# Altium project OpAmp_Type_3.PrjPcb
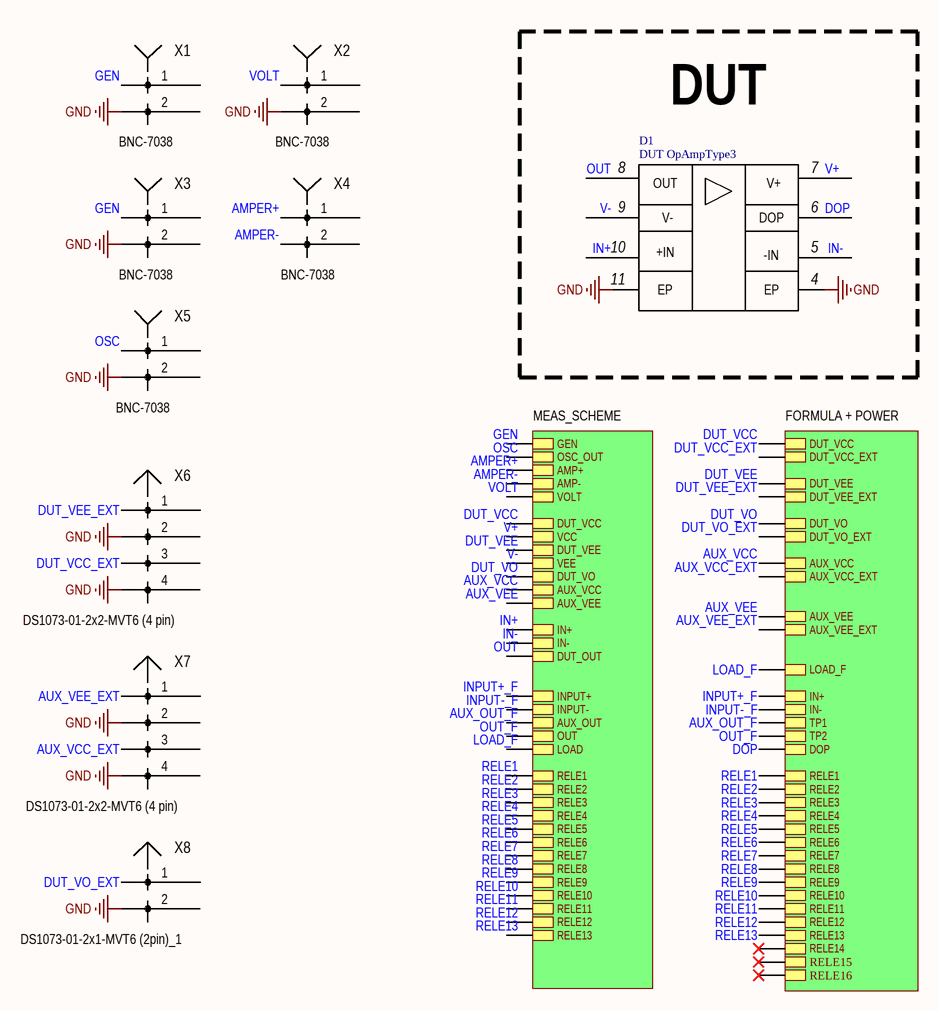
[diagram p0: Main.SchDoc]
4 sheets, 178 parts. Net scope: hierarchical (ports join the sheet entries above them; power ports are global).
Board file: PCB1.PcbDoc
Sheets:
  Main.SchDoc
    FORMULA + POWER = FORMULA.SchDoc
    MEAS_SCHEME = MEAS_SCHEME.SchDoc
      RELE = RELE_BLOCK.SchDoc
      RELE = RELE_BLOCK.SchDoc
      RELE = RELE_BLOCK.SchDoc
      RELE = RELE_BLOCK.SchDoc
      RELE = RELE_BLOCK.SchDoc
      RELE = RELE_BLOCK.SchDoc
      RELE = RELE_BLOCK.SchDoc
      RELE = RELE_BLOCK.SchDoc
      RELE = RELE_BLOCK.SchDoc
      RELE = RELE_BLOCK.SchDoc
      RELE = RELE_BLOCK.SchDoc
      RELE 1 = RELE_BLOCK.SchDoc
      RELE = RELE_BLOCK.SchDoc
      RELE = RELE_BLOCK.SchDoc

## Sheet Main.SchDoc: ТО2192
size 209 x 297 mm; ApprovedBy: Кубатко В.А.; CheckedBy: Кубатко В.А.; Author: Сергеев Д.А.; CompanyName: ГК "СНАБЖЕНИЕ"; DrawnBy: Сергеев Д.А,; Engineer: Сергеев Д.А.; Organization: ГК "СНАБЖЕНИЕ"; DocumentNumber: ТО2192; Revision: 1; SheetNumber: 1; SheetTotal: 4

### Parts
D1  DUT OpAmpType3  [DIP 14]
X1  BNC-7038  [BNC-7038]
X2  BNC-7038  [BNC-7038]
X3  BNC-7038  [BNC-7038]
X4  BNC-7038  [BNC-7038]
X5  BNC-7038  [BNC-7038]
X6  DS1073-01-2x2-MVT6 (4 pin)  [DS1073-01-2x2-MVT6 (4 pin)]
X7  DS1073-01-2x2-MVT6 (4 pin)  [DS1073-01-2x2-MVT6 (4 pin)]
X8  DS1073-01-2x1-MVT6 (2pin)_1  [DS1073-01-2x1-MVT6 (2 pin) - duplicate]

### Blocks framed on the sheet
DUT: D1

### Sub-sheets
FORMULA + POWER = FORMULA.SchDoc: DUT_VEE, DUT_VCC, DUT_VO, RELE1, RELE9, RELE11, RELE5, RELE2, RELE7, RELE13, RELE12, RELE14, RELE4, RELE6, RELE3, RELE8, RELE10, AUX_VCC, DUT_VCC_EXT, AUX_VEE_EXT, DUT_VO_EXT, AUX_VEE, AUX_VCC_EXT, DUT_VEE_EXT, IN-, TP1, DOP, IN+, TP2, LOAD_F, RELE15, RELE16
MEAS_SCHEME = MEAS_SCHEME.SchDoc: GEN, OSC_OUT, AMP-, VOLT, DUT_VEE, VCC, AMP+, VEE, RELE2, DUT_VCC, RELE5, RELE4, RELE6, RELE3, RELE9, RELE10, RELE13, DUT_VO, IN-, RELE8, RELE12, RELE11, IN+, AUX_VEE, RELE7, AUX_VCC, OUT, AUX_OUT, INPUT-, INPUT+, DUT_OUT, LOAD, RELE1

### Nets
GND: D1.4 D1.11 X1.2 X2.2 X3.2 X5.2 X6.2 X6.4 X7.2 X7.4 X8.2
AMPER+: X4.1 ; sheet MEAS_SCHEME/AMP+  [project net AMP+]
AMPER-: X4.2 ; sheet MEAS_SCHEME/AMP-  [project net AMP-]
AUX_OUT_F: sheet FORMULA + POWER/TP1, sheet MEAS_SCHEME/AUX_OUT  [project net AUX_OUT]
AUX_VCC: sheet FORMULA + POWER/AUX_VCC, sheet MEAS_SCHEME/AUX_VCC
AUX_VCC_EXT: X7.3 ; sheet FORMULA + POWER/AUX_VCC_EXT  [project net +12V]
AUX_VEE: sheet FORMULA + POWER/AUX_VEE, sheet MEAS_SCHEME/AUX_VEE
AUX_VEE_EXT: X7.1 ; sheet FORMULA + POWER/AUX_VEE_EXT  [project net -12V]
DOP: D1.6 ; sheet FORMULA + POWER/DOP
DUT_VCC: sheet FORMULA + POWER/DUT_VCC, sheet MEAS_SCHEME/DUT_VCC
DUT_VCC_EXT: X6.3 ; sheet FORMULA + POWER/DUT_VCC_EXT
DUT_VEE: sheet FORMULA + POWER/DUT_VEE, sheet MEAS_SCHEME/DUT_VEE
DUT_VEE_EXT: X6.1 ; sheet FORMULA + POWER/DUT_VEE_EXT
DUT_VO: sheet FORMULA + POWER/DUT_VO, sheet MEAS_SCHEME/DUT_VO
DUT_VO_EXT: X8.1 ; sheet FORMULA + POWER/DUT_VO_EXT
GEN: X1.1 X3.1 ; sheet MEAS_SCHEME/GEN
IN+: D1.10 ; sheet MEAS_SCHEME/IN+
IN-: D1.5 ; sheet MEAS_SCHEME/IN-
INPUT+_F: sheet FORMULA + POWER/IN+, sheet MEAS_SCHEME/INPUT+  [project net INPUT+]
INPUT-_F: sheet FORMULA + POWER/IN-, sheet MEAS_SCHEME/INPUT-  [project net INPUT-]
LOAD_F: sheet FORMULA + POWER/LOAD_F, sheet MEAS_SCHEME/LOAD
OSC: X5.1 ; sheet MEAS_SCHEME/OSC_OUT
OUT: D1.8 ; sheet MEAS_SCHEME/DUT_OUT  [project net DUT_OUT]
OUT_F: sheet FORMULA + POWER/TP2, sheet MEAS_SCHEME/OUT  [project net OUT]
RELE1: sheet FORMULA + POWER/RELE1, sheet MEAS_SCHEME/RELE1
RELE2: sheet FORMULA + POWER/RELE2, sheet MEAS_SCHEME/RELE2
RELE3: sheet FORMULA + POWER/RELE3, sheet MEAS_SCHEME/RELE3
RELE4: sheet FORMULA + POWER/RELE4, sheet MEAS_SCHEME/RELE4
RELE5: sheet FORMULA + POWER/RELE5, sheet MEAS_SCHEME/RELE5
RELE6: sheet FORMULA + POWER/RELE6, sheet MEAS_SCHEME/RELE6
RELE7: sheet FORMULA + POWER/RELE7, sheet MEAS_SCHEME/RELE7
RELE8: sheet FORMULA + POWER/RELE8, sheet MEAS_SCHEME/RELE8
RELE9: sheet FORMULA + POWER/RELE9, sheet MEAS_SCHEME/RELE9
RELE10: sheet FORMULA + POWER/RELE10, sheet MEAS_SCHEME/RELE10
RELE11: sheet FORMULA + POWER/RELE11, sheet MEAS_SCHEME/RELE11
RELE12: sheet FORMULA + POWER/RELE12, sheet MEAS_SCHEME/RELE12
RELE13: sheet FORMULA + POWER/RELE13, sheet MEAS_SCHEME/RELE13
V+: D1.7 ; sheet MEAS_SCHEME/VCC
V-: D1.9 ; sheet MEAS_SCHEME/VEE
VOLT: X2.1 ; sheet MEAS_SCHEME/VOLT

### Notes on the sheet
- Перв. примен.
- Справ. №
- Подп. и дата
- Инв. № дубл.
- Взам. инв. №
- Разраб.
- Изм.
- Лист
- № докум.
- Подп.
- Дата
- Литера
- Масса
- Масштаб
- Пров.
- Т.контр.
- Листов
- Инв. № подл.
- Н.контр.
- Утв.
- Форма 1 ГОСТ 2.104-2006
- Копировал
- Формат А4
- (in symbol AMS1117-3.3 (SOT-223)) *STU
- (in symbol LM96000) SMBDAT; PWM1/xTESTOUT; T; SMBCLK; VCCP_IN; GND; 2.5V; 3.3V; 12V; VID0; 5V; VID1; VID4; VID2; REMOTE1+; VID3; REMOTE1-; TACH3; REMOTE2+; PWM2; REMOTE2-; TACH1; TACH4/ADDSEL; TACH2; PWM3/ADDENABLE
- (in symbol M1-SPI-ATM64(V2), part A) GND; 3; PE5_INT5; 4; 5; PF0_ADC0; 6; 7; AREF; 8; 9; PD7_T2; PD6_T1; 10; 11; PD4; PD5; 12; 13; PB1_CLK; PB0_CS; 14; 15; PD0_SCL; PD1_SDA; 16; 17; PB2_DO; PB3_DI; 18; 19; PE0_RX0; PE1_TX0; 20
- (in symbol M1-SPI-ATM64(V2), part B) PE7_INT7; PB4_OC0; 3; PB5_OC1A; PB6_OC1B; 4; 5; RST_FRM; PC0; 6; 7; PC1; PC2; 8; 9; PC3; PC4; 10; 11; PC5; PC6; 12; 13; PC7; PA7; 14; 15; PA6; PA5; 16; 17; PA4; PA3; 18; 19; PA2; PA1; 20; 21; PA0; VCC_M64; 22; 23; PF1_ADC1; 24; 25; PE6_INT6; 26; 27; BOOT; 28

### Library data of the parts
D1 = OpAmpType3
X6 X7 = DS1073-01-2x2-MVT6 (4 pin): ComponentHeigt: 5.5; Name: Вилка; Specification: Вилка PLD2-2 *; Typ: PLD2-2; ClassName: *; Component Link: *; ComponentWeigt: *; Firme: *; Leadform: *; NN: *; KIND: *
X8 = DS1073-01-2x1-MVT6 (2pin)_1: ComponentHeigt: 5.5; Name: Вилка; Specification: Вилка PLD2-2 *; Typ: PLD2-2; ClassName: *; Component Link: *; ComponentWeigt: *; Firme: *; Leadform: *; NN: *; KIND: *

## Sheet FORMULA.SchDoc
size A3; DocumentNumber: ТО2192; SheetNumber: 2; SheetTotal: 4
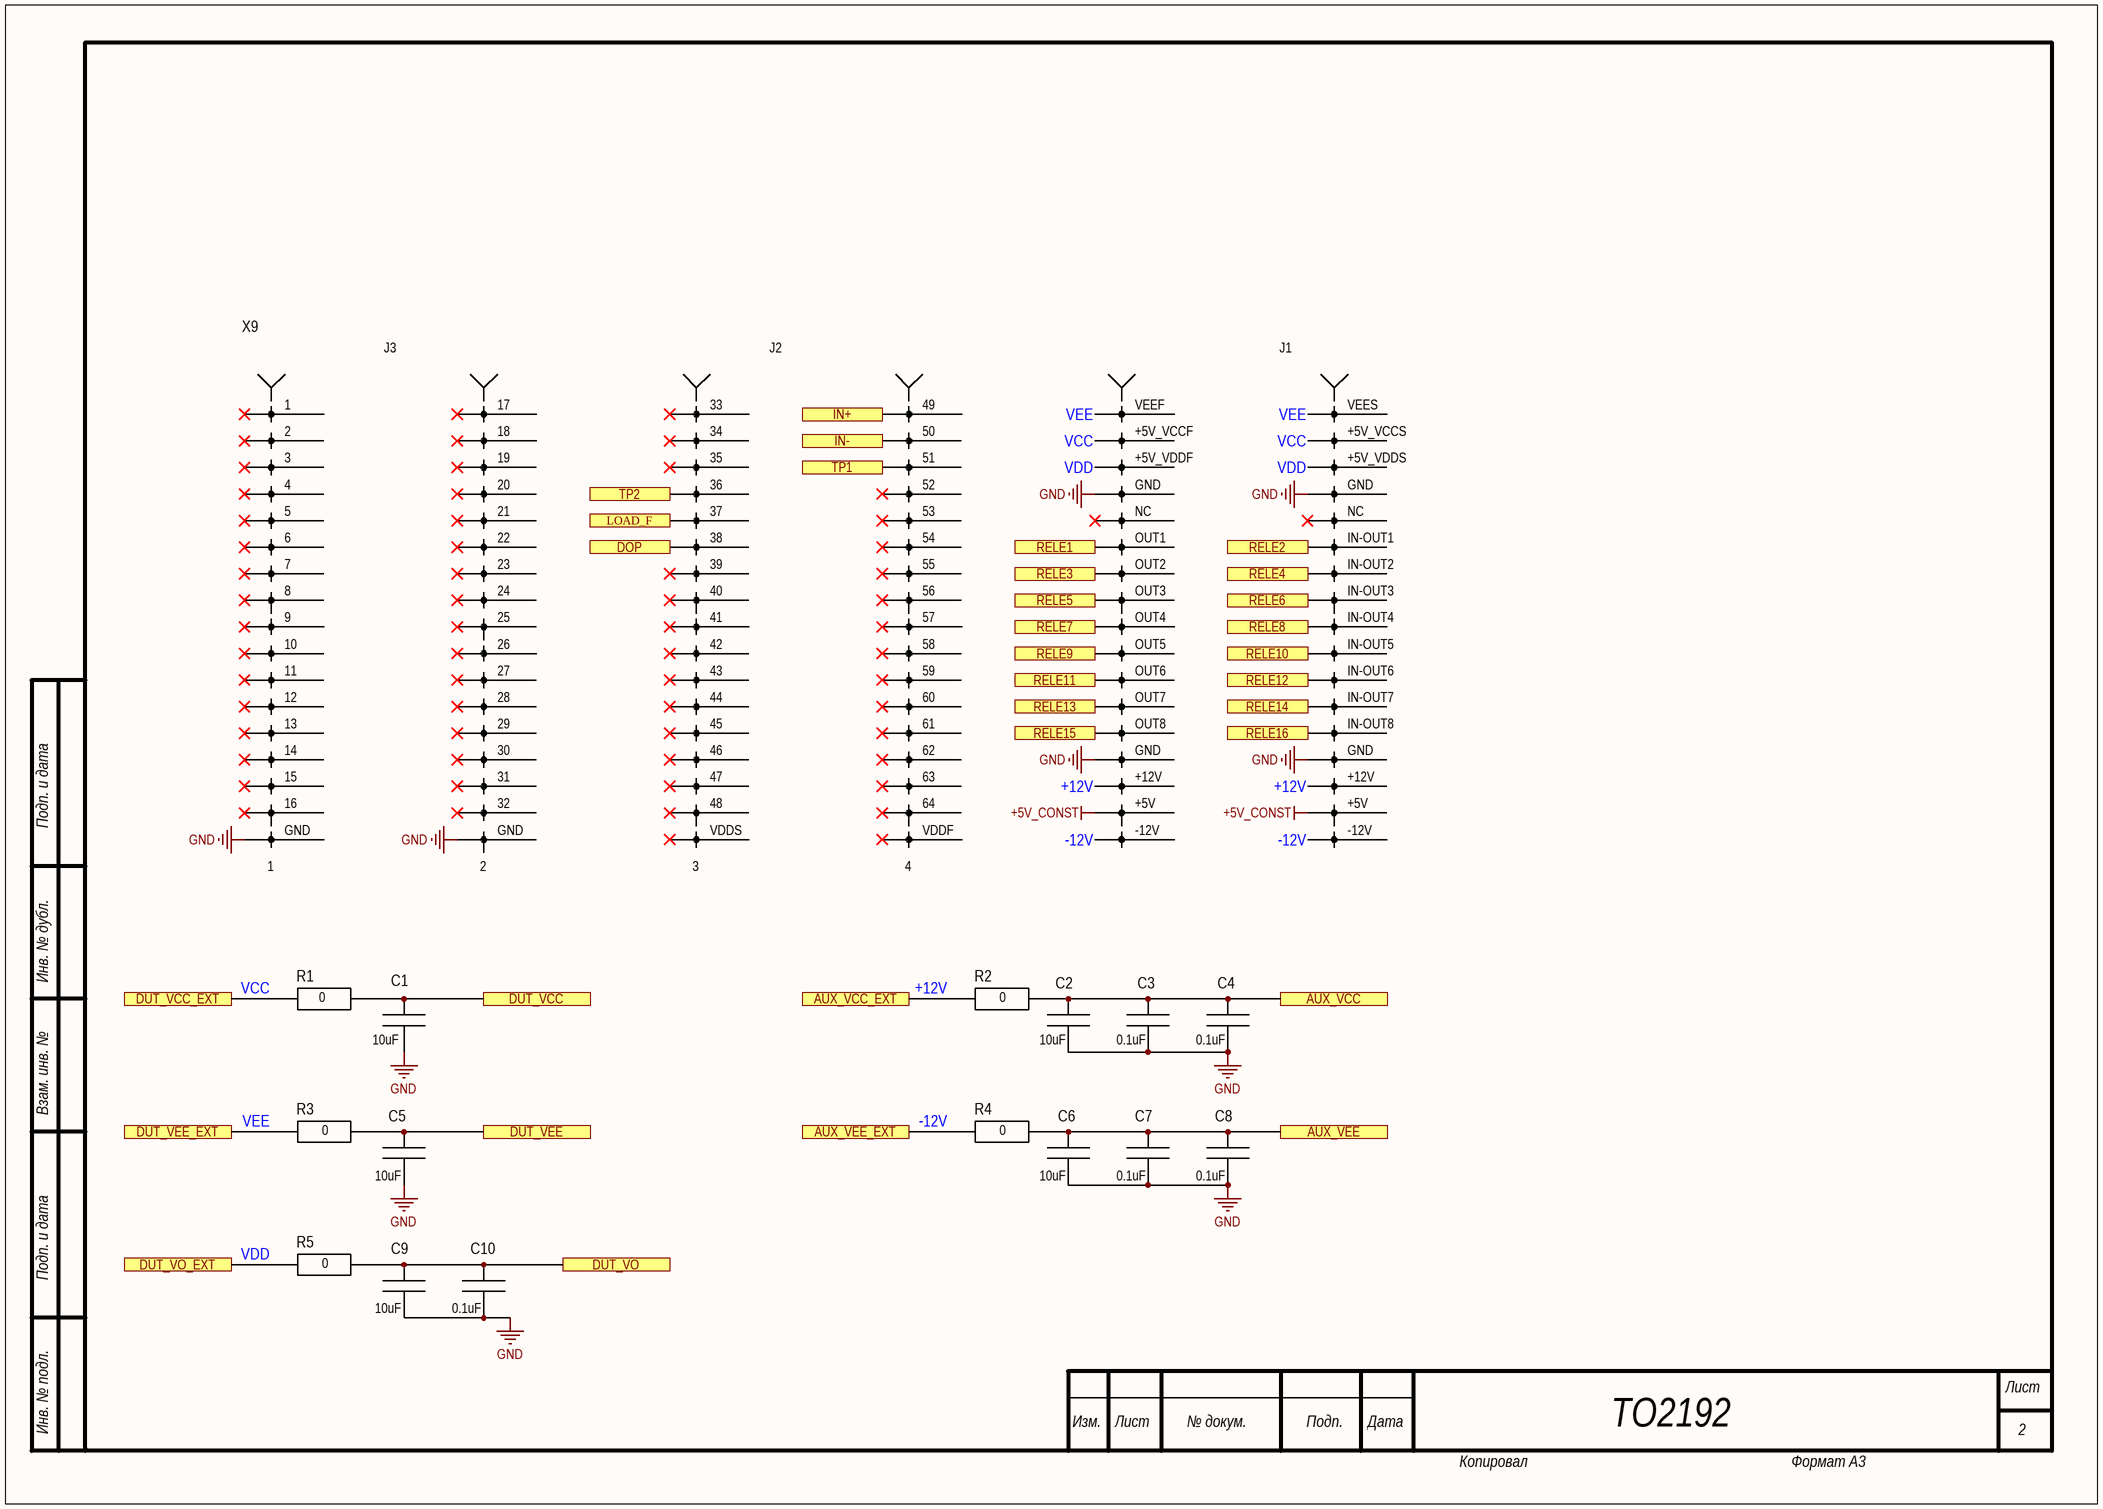
[diagram p1: FORMULA.SchDoc]

### Parts
C1  10uF  [0805]
C2  10uF  [0805]
C3  0.1uF  [0805]
C4  0.1uF  [0805]
C5  10uF  [0805]
C6  10uF  [0805]
C7  0.1uF  [0805]
C8  0.1uF  [0805]
C9  10uF  [0805]
C10  0.1uF  [0805]
R1  0  [0805]
R2  0  [0805]
R3  0  [0805]
R4  0  [0805]
R5  0  [0805]
X9  FORMULA  [FORMULA]  (value not drawn)

### Ports
AUX_VCC, AUX_VCC_EXT, AUX_VEE, AUX_VEE_EXT, DOP, DUT_VCC, DUT_VCC_EXT, DUT_VEE, DUT_VEE_EXT, DUT_VO, DUT_VO_EXT, IN+, IN-, LOAD_F, RELE1, RELE2, RELE3, RELE4, RELE5, RELE6, RELE7, RELE8, RELE9, RELE10, RELE11, RELE12, RELE13, RELE14, RELE15, RELE16, TP1, TP2

### Nets
+5V_CONST: X9.+5V
GND: C1.2 C2.2 C3.2 C4.2 C5.2 C6.2 C7.2 C8.2 C9.2 C10.2 X9.GND
+12V: R2.2 X9.+12V ; port AUX_VCC_EXT
-12V: R4.2 X9.-12V ; port AUX_VEE_EXT
AUX_OUT: X9.51 ; port TP1
AUX_VCC: C2.1 C3.1 C4.1 R2.1 ; port AUX_VCC
AUX_VEE: C6.1 C7.1 C8.1 R4.1 ; port AUX_VEE
DOP: X9.38 ; port DOP
DUT_VCC: C1.1 R1.2 ; port DUT_VCC
DUT_VEE: C5.1 R3.1 ; port DUT_VEE
DUT_VO: C9.1 C10.1 R5.1 ; port DUT_VO
INPUT+: X9.49 ; port IN+
INPUT-: X9.50 ; port IN-
LOAD_F: X9.37 ; port LOAD_F
OUT: X9.36 ; port TP2
RELE1: X9.OUT1 ; port RELE1
RELE2: X9.IN-OUT1 ; port RELE2
RELE3: X9.OUT2 ; port RELE3
RELE4: X9.IN-OUT2 ; port RELE4
RELE5: X9.OUT3 ; port RELE5
RELE6: X9.IN-OUT3 ; port RELE6
RELE7: X9.OUT4 ; port RELE7
RELE8: X9.IN-OUT4 ; port RELE8
RELE9: X9.OUT5 ; port RELE9
RELE10: X9.IN-OUT5 ; port RELE10
RELE11: X9.OUT6 ; port RELE11
RELE12: X9.IN-OUT6 ; port RELE12
RELE13: X9.OUT7 ; port RELE13
VCC: R1.1 X9.+5V_VCCF(VCCF) X9.+5V_VCCS(VCCS) ; port DUT_VCC_EXT  [project net DUT_VCC_EXT]
VDD: R5.2 X9.+5V_VDDF(VDDF) X9.+5V_VDDS(VDDS) ; port DUT_VO_EXT  [project net DUT_VO_EXT]
VEE: R3.2 X9.VEEF X9.VEES ; port DUT_VEE_EXT  [project net DUT_VEE_EXT]
NetX9_IN-OUT7: X9.IN-OUT7 ; port RELE14
NetX9_IN-OUT8: X9.IN-OUT8 ; port RELE16
NetX9_OUT8: X9.OUT8 ; port RELE15

Not connected (* = marked no-connect by the designer): X9 1* 2* 3* 4* 5* 6* 7* 8* 9* 10* 11* 12* 13* 14* 15* 16* 17* 18* 19* 20* 21* 22* 23* 24* 25* 26* 27* 28* 29* 30* 31* 32* 33* 34* 35* 39* 40* 41* 42* 43* 44* 45* 46* 47* 48* 52* 53* 54* 55* 56* 57* 58* 59* 60* 61* 62* 63* 64* NC* VDDF* VDDS*

### Notes on the sheet
- Подп. и дата
- Инв. № дубл.
- Взам. инв. №
- Лист
- Инв. № подл.
- Изм.
- № докум.
- Подп.
- Дата
- ТО2192
- 2
- Копировал
- Формат А3
- Перв. примен.
- Справ. №
- Разраб.
- Литера
- Масса
- Масштаб
- Пров.
- Т.контр.
- Листов
- Н.контр.
- Утв.
- Форма 1 ГОСТ 2.104-2006
- (in symbol FORMULA) J3; J2; J1

### Library data of the parts
C1-C10 = C0805: ComponentHeigt: 1.3; Firme: AVX; Leadform: SMD; KIND: Конденсатор; ClassName: *; Component Link: *; ComponentWeigt: *; Packaging: 0805; NN: *; Value: *
R1-R5 = R0805 Yageo: ComponentHeigt: 0.6; Firme: Yageo; Leadform: SMD; Kind: Резистор; ClassName: *; ComponentWeigt: *; Component Link: *; Packaging: 0805; NN: *; Value: *

## Sheet MEAS_SCHEME.SchDoc
size 549 x 325 mm; DocumentNumber: ТО2192; SheetNumber: 3; SheetTotal: 4
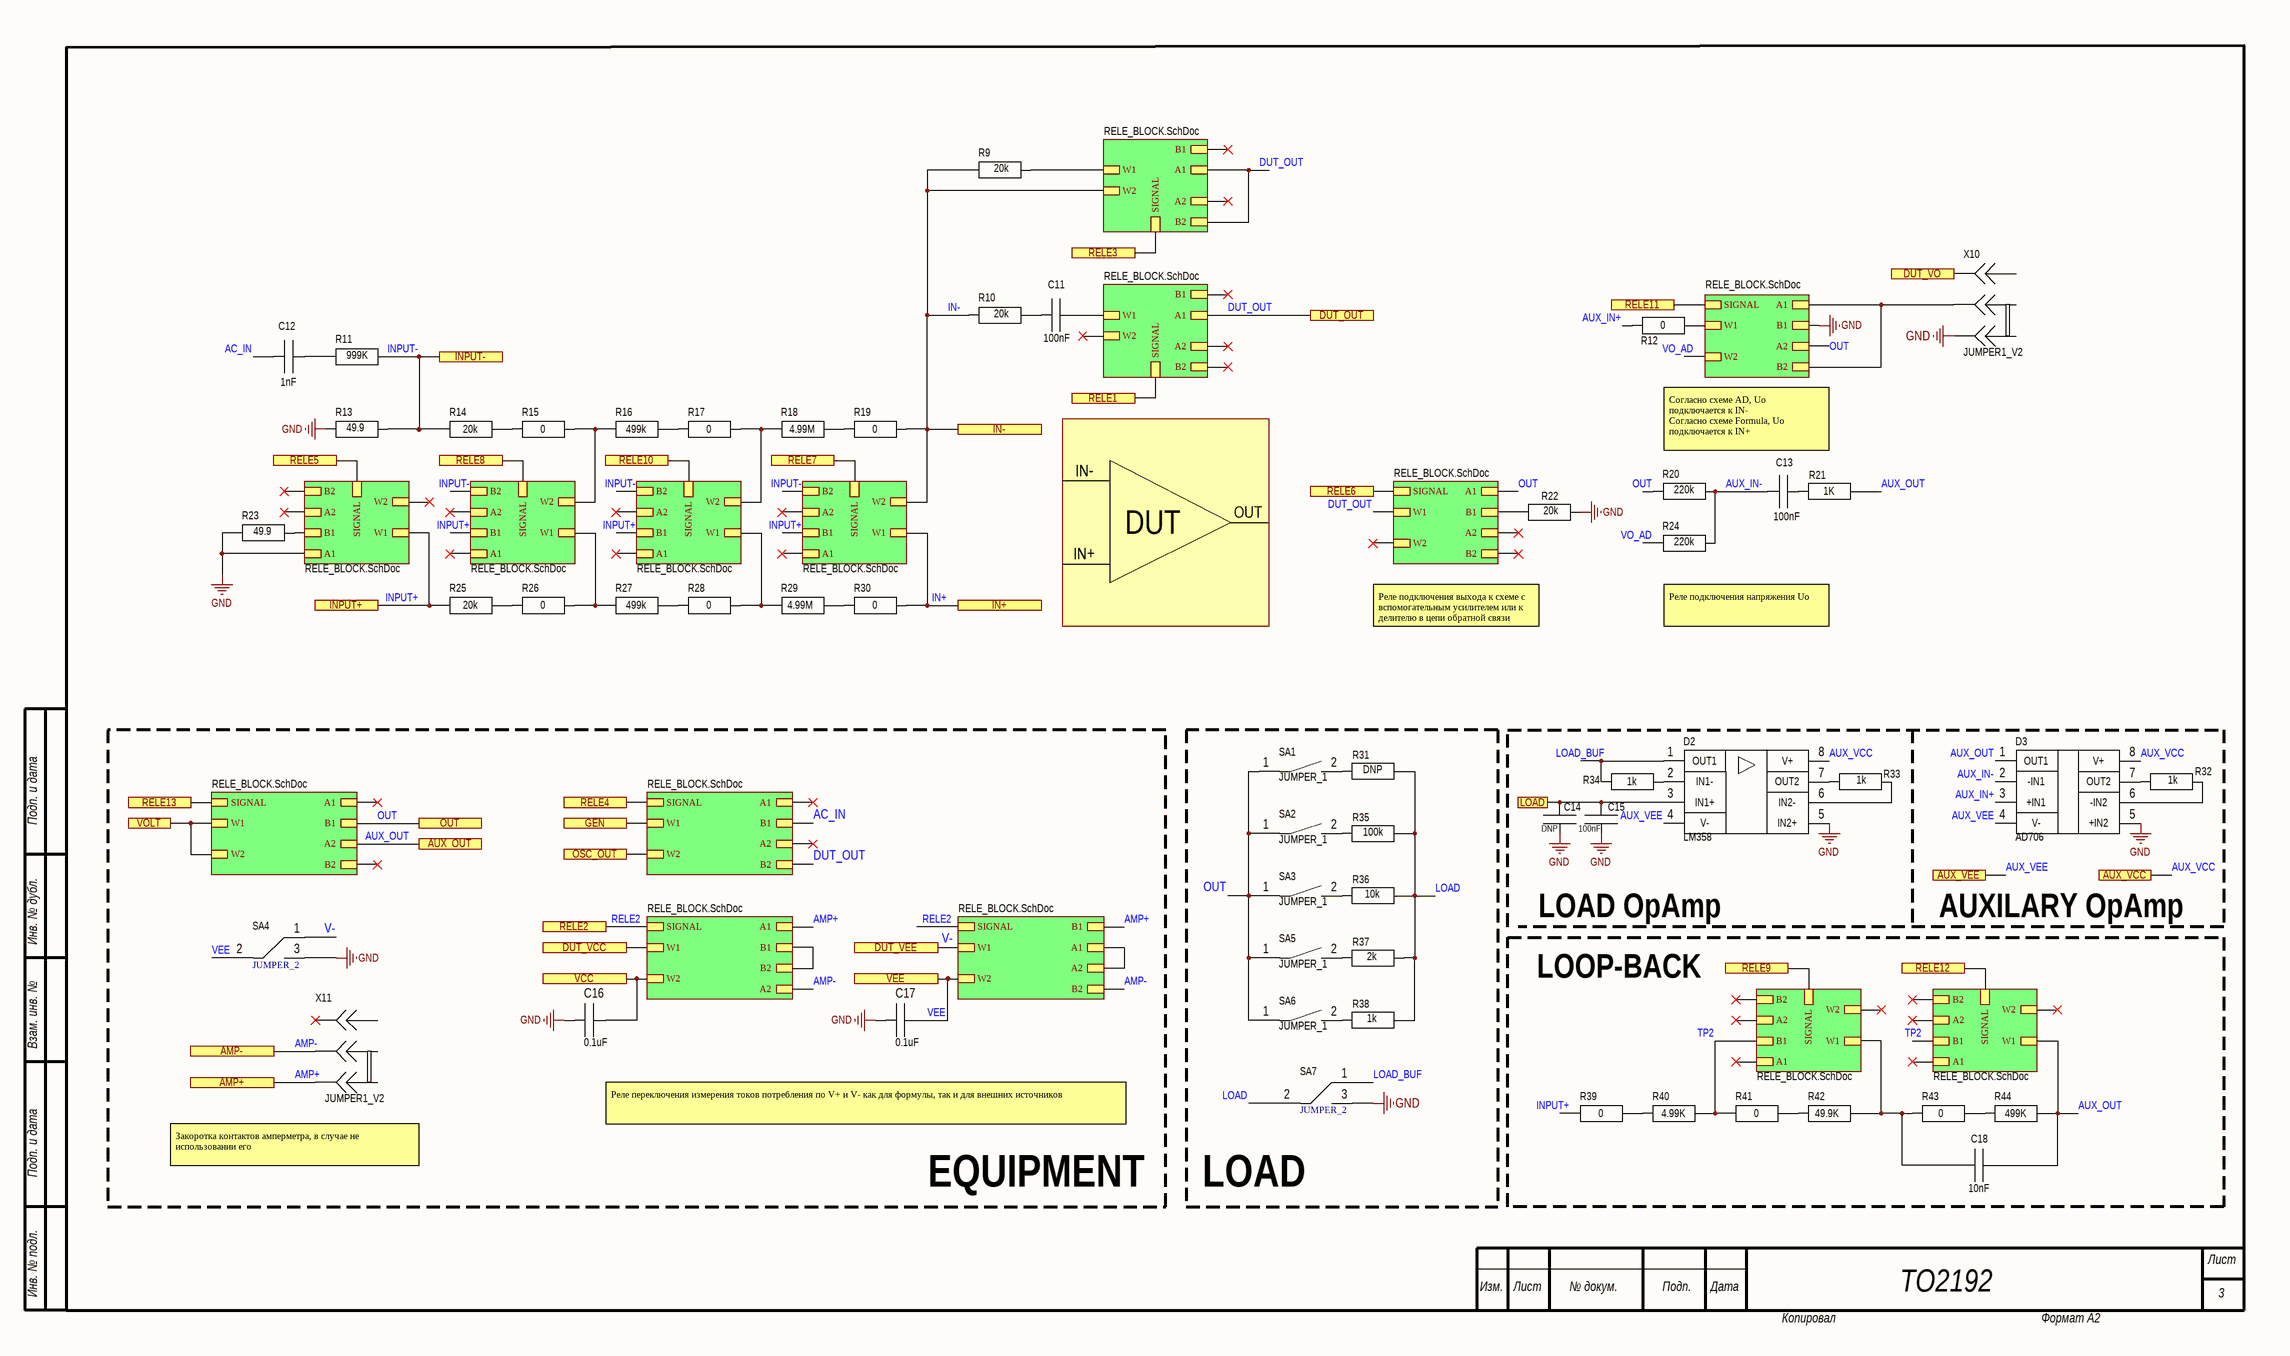
[diagram p2: MEAS_SCHEME.SchDoc]

### Parts
(Parts that share a designator on the sheet are numbered #1, #2 ... from top to bottom, then left to right.)
C11  100nF  [0805]
C12  1nF  [0805]
C13  100nF  [0805]
C14  DNP  [0805]
C15  100nF  [1210]
C16  0.1uF  [0805]
C17  0.1uF  [0805]
C18  10nF  [0805]
D2  LM358  [SOIC-8(R-8)]
D3  AD706  [SOIC-8(R-8)]
R9  20k  [0805]
R10  20k  [0805]
R11  999K  [0805]
R12  0  [1206]
R13  49.9  [0805]
R14  20k  [0805]
R15  0  [0805]
R16  499k  [0805]
R17  0  [0805]
R18  4.99M  [0805]
R19  0  [0805]
R20  220k  [1206]
R21  1K  [0805]
R22  20k  [0805]
R23  49.9  [0805]
R24  220k  [0805]
R25  20k  [0805]
R26  0  [0805]
R27  499k  [0805]
R28  0  [0805]
R29  4.99M  [0805]
R30  0  [0805]
R31  DNP  [0805]
R32  1k  [0805]
R33  1k  [0805]
R34  1k  [1206]
R35#1  100k  [0805]
R36#1  10k  [0805]
R37#1  2k  [0805]
R38#1  1k  [0805]
R39#1  0  [0805]
R40#1  4.99K  [0805]
R41#1  0  [0805]
R42#1  49.9K  [0805]
R43#1  0  [0805]
R44#1  499K  [0805]
SA1  JUMPER_1  [PLS2-2,54]
SA2  JUMPER_1  [PLS2-2,54]
SA3  JUMPER_1  [PLS2-2,54]
SA4  JUMPER_2  [PLS3-2,54]
SA5  JUMPER_1  [PLS2-2,54]
SA6  JUMPER_1  [PLS2-2,54]
SA7  JUMPER_2  [PLS3-2,54]
X10  JUMPER1_V2  [PLS3-2,54]
X11  JUMPER1_V2  [PLS3-2,54]

### Blocks framed on the sheet
EQUIPMENT: C16 C17 SA4 X11
LOAD: R31 R35#1 R36#1 R37#1 R38#1 SA1-SA3 SA5-SA7
LOOP-BACK: C18 R39#1 R40#1 R41#1 R42#1 R43#1 R44#1

### Sub-sheets
RELE = RELE_BLOCK.SchDoc: W2, A2, SIGNAL, A1, B2, W1, B1
RELE = RELE_BLOCK.SchDoc: W2, A2, SIGNAL, A1, B2, W1, B1
RELE = RELE_BLOCK.SchDoc: W2, A2, SIGNAL, A1, B2, W1, B1
RELE = RELE_BLOCK.SchDoc: W2, A2, SIGNAL, A1, B2, W1, B1
RELE = RELE_BLOCK.SchDoc: W2, A2, SIGNAL, A1, B2, W1, B1
RELE = RELE_BLOCK.SchDoc: W2, A2, SIGNAL, A1, B2, W1, B1
RELE = RELE_BLOCK.SchDoc: W2, A2, SIGNAL, A1, B2, W1, B1
RELE = RELE_BLOCK.SchDoc: W2, A2, SIGNAL, A1, B2, W1, B1
RELE = RELE_BLOCK.SchDoc: W2, A2, SIGNAL, A1, B2, W1, B1
RELE = RELE_BLOCK.SchDoc: W2, A2, SIGNAL, A1, B2, W1, B1
RELE = RELE_BLOCK.SchDoc: W2, A2, SIGNAL, A1, B2, W1, B1
RELE = RELE_BLOCK.SchDoc: W2, A2, SIGNAL, A1, B2, W1, B1
RELE = RELE_BLOCK.SchDoc: W2, A2, SIGNAL, A1, B2, W1, B1
RELE 1 = RELE_BLOCK.SchDoc: W2, A2, SIGNAL, A1, B2, W1, B1

### Ports
AMP+, AMP-, AUX_OUT, AUX_VCC, AUX_VEE, DUT_OUT, DUT_VCC, DUT_VEE, DUT_VO, GEN, IN+, IN-, INPUT+, INPUT-, LOAD, OSC_OUT, OUT, RELE1, RELE2, RELE3, RELE4, RELE5, RELE6, RELE7, RELE8, RELE9, RELE10, RELE11, RELE12, RELE13, VCC, VEE, VOLT

### Nets
GND: C14.2 C15.2 C16.2 C17.2 D2.5 D3.5 R13.2 R22.1 R23.2 SA4.3 SA7.3 X10.1 ; sheet RELE/A1, sheet RELE/B1
AC_IN: C12.2 ; sheet RELE/B1
AMP+: X11.1 ; port AMP+, sheet RELE/A1, sheet RELE/B1
AMP-: X11.2 ; port AMP-, sheet RELE/A2, sheet RELE/B2
AUX_IN+: D3.3 R12.2
AUX_IN-: C13.1 D3.2 R20.2 R24.2
AUX_OUT: C18.1 D3.1 R21.2 R44#1.1 ; port AUX_OUT, sheet RELE/W1, sheet RELE 1/A2
AUX_VCC: D2.8 D3.8 ; port AUX_VCC
AUX_VEE: D2.4 D3.4 ; port AUX_VEE
DUT_OUT: port DUT_OUT, sheet RELE/B2, sheet RELE/W1, sheet RELE/A1, sheet RELE/A1, sheet RELE/B2
DUT_VCC: port DUT_VCC, sheet RELE/W1
DUT_VO: X10.3 ; port DUT_VO
GEN: port GEN, sheet RELE/W1
IN+: R30.1 ; port IN+, sheet RELE/W1
IN-: R9.2 R10.2 R19.1 ; port IN-, sheet RELE/W2, sheet RELE/W2
INPUT+: R25.2 R39#1.2 ; port INPUT+, sheet RELE/B1, sheet RELE/B1, sheet RELE/B1, sheet RELE/W1
INPUT-: R11.1 R13.1 R14.2 ; port INPUT-, sheet RELE/B2, sheet RELE/B2, sheet RELE/B2
LOAD: R31.2 R35#1.2 R36#1.2 R37#1.2 R38#1.2 SA7.2
LOAD_BUF: D2.1 R34.1 SA7.1
LOAD_F: C14.1 C15.1 D2.3 ; port LOAD
OSC: port OSC_OUT, sheet RELE/W2
OUT: R20.1 SA1.1 SA2.1 SA3.1 SA5.1 SA6.1 ; port OUT, sheet RELE/A2, sheet RELE/A1, sheet RELE 1/B1
RELE1: port RELE1, sheet RELE/SIGNAL
RELE2: port RELE2, sheet RELE/SIGNAL, sheet RELE/SIGNAL
RELE3: port RELE3, sheet RELE/SIGNAL
RELE4: port RELE4, sheet RELE/SIGNAL
RELE5: port RELE5, sheet RELE/SIGNAL
RELE6: port RELE6, sheet RELE/SIGNAL
RELE7: port RELE7, sheet RELE/SIGNAL
RELE8: port RELE8, sheet RELE/SIGNAL
RELE9: port RELE9, sheet RELE/SIGNAL
RELE10: port RELE10, sheet RELE/SIGNAL
RELE11: port RELE11, sheet RELE/SIGNAL
RELE12: port RELE12, sheet RELE/SIGNAL
RELE13: port RELE13, sheet RELE 1/SIGNAL
TP2: R40#1.1 R41#1.2 ; sheet RELE/B1, sheet RELE/B1
V+: C16.1 ; port VCC, sheet RELE/W2
V-: SA4.1 ; port DUT_VEE, sheet RELE/W1  [project net DUT_VEE]
VEE: C17.1 SA4.2 ; port VEE, sheet RELE/W2  [project net V-]
VO_AD: R24.1 ; sheet RELE/W2
VOLT: port VOLT, sheet RELE 1/W2, sheet RELE 1/W1
NetC11_1: C11.1 ; sheet RELE/W1
NetC11_2: C11.2 R10.1
NetC12_1: C12.1 R11.2
NetC13_2: C13.2 R21.1
NetC18_2: C18.2 R42#1.1 R43#1.2 ; sheet RELE/W1
NetD2_2: D2.2 R34.2
NetD2_6: D2.6 R33.1
NetD2_7: D2.7 R33.2
NetD3_6: D3.6 R32.1
NetD3_7: D3.7 R32.2
NetK1_4: R9.1 ; sheet RELE/W1
NetK5_5: R22.2 ; sheet RELE/B1
NetK6_3: X10.2 ; sheet RELE/A1, sheet RELE/B2
NetK6_4: R12.1 ; sheet RELE/W1
NetK7_5: R23.1 ; sheet RELE/B1
NetK8_4: R26.1 R27.2 ; sheet RELE/W1
NetK8_9: R15.1 R16.2 ; sheet RELE/W2
NetK9_4: R28.1 R29.2 ; sheet RELE/W1
NetK9_9: R17.1 R18.2 ; sheet RELE/W2
NetK11_5: sheet RELE/B2, sheet RELE/B1
NetK14_3: sheet RELE/A2, sheet RELE/A1
NetR14_1: R14.1 R15.2
NetR16_1: R16.1 R17.2
NetR18_1: R18.1 R19.2
NetR25_1: R25.1 R26.2
NetR27_1: R27.1 R28.2
NetR29_1: R29.1 R30.2
NetR31_1: R31.1 SA1.2
NetR35#1_1: R35#1.1 SA2.2
NetR36#1_1: R36#1.1 SA3.2
NetR37#1_1: R37#1.1 SA5.2
NetR38#1_1: R38#1.1 SA6.2
NetR39#1_1: R39#1.1 R40#1.2
NetR41#1_1: R41#1.1 R42#1.2
NetR43#1_1: R43#1.1 R44#1.2

Not connected (* = marked no-connect by the designer): X11 3*

### Notes on the sheet
- IN-
- Согласно схеме AD, Uo подключается к IN-
  Согласно схеме Formula, Uo подключается к IN+
- DUT
- OUT
- IN+
- Реле подключения выхода к схеме с вспомогательным усилителем или к делителю в цепи обратной связи
- (near R24) Реле подключения напряжения Uo
- Подп. и дата
- Инв. № дубл.
- LOAD OpAmp
- AUXILARY OpAmp
- Взам. инв. №
- (near X11) Закоротка контактов амперметра, в случае не использовании его
- Реле переключения измерения токов потребления по V+ и V- как для формулы, так и для внешних источников
- Лист
- Инв. № подл.
- Изм.
- № докум.
- Подп.
- Дата
- ТО2192
- 3
- Копировал
- Формат А2
- DWG. NO.
- REV.
- SHT.
- REVISION
- DESCRIPTION
- DATE
- APPROVED
- THIS DOCUMENT AND THE DATA DISCLOSED HEREIN OR HEREWITH IS THE PROPERTY OF ALTIUM LIMITED AND MAY BE FREELY DISTRIBUTED IN WHOLE. NO RIGHTS ARE RESERVED OR EXPRESS OR IMPLIED WARANTEE GIVEN.
- ENG:
- DSN:
- APPROVALS
- PROJECT
- DOCUMENT REVISION:
- DESIGN ITEM:
- CHK:
- BOM:
- REFERENCE DOCUMENTS
- PROJECT REVISION:
- TITLE
- FAB DWG:
- PCB DWG:
- ASSY DWG:
- SCALE:
- SIZE
- C
- CAGE CODE
- FILE NAME
- DWG NO.
- SHEET
- OF
- REV
- (in symbol AD706) OUT1; V+; -IN1; OUT2; +IN1; -IN2; V-; +IN2
- (in symbol LM358) OUT1; V+; IN1-; OUT2; IN1+; IN2-; V-; IN2+

### Library data of the parts
C11-C14 C16-C18 = C0805: as C1 on sheet FORMULA; ClassName: *; Component Link: *; ComponentWeigt: *; Packaging: 0805; NN: *; Value: *
C15 = C1210: ComponentHeigt: 1.3; Firme: AVX; Leadform: SMD; KIND: Конденсатор; ClassName: *; Component Link: *; ComponentWeigt: *; Packaging: 0805; NN: *; Value: *
R9-R11 R13-R19 R21-R23 R25-R33 R35#1 R36#1 R37#1 R38#1 R39#1 R40#1 R41#1 R42#1 R43#1 R44#1 = R0805 Yageo: as R1 on sheet FORMULA; ClassName: *; ComponentWeigt: *; Component Link: *; Packaging: 0805; NN: *; Value: *
R12 R20 R34 = R1206 Yageo: ComponentHeigt: 0.6; Firme: Yageo; Leadform: SMD; Kind: Резистор; ClassName: *; ComponentWeigt: *; Component Link: *; Packaging: 0805; NN: *; Value: *
R24 = R0805 Yageo: По схеме AD 220k, по схеме Formula 10k; ComponentHeigt: 0.6; Firme: Yageo; Leadform: SMD; Kind: Резистор; ClassName: *; ComponentWeigt: *; Component Link: *; Packaging: 0805; NN: *; Value: *

## Sheet RELE_BLOCK.SchDoc
size A4; DocumentNumber: ТО2192; SheetNumber: 4; SheetTotal: 4
Used 14 times, as channels MEAS_SCHEME/RELE, MEAS_SCHEME/RELE, MEAS_SCHEME/RELE, MEAS_SCHEME/RELE, MEAS_SCHEME/RELE, MEAS_SCHEME/RELE, MEAS_SCHEME/RELE, MEAS_SCHEME/RELE, MEAS_SCHEME/RELE, MEAS_SCHEME/RELE, MEAS_SCHEME/RELE, MEAS_SCHEME/RELE 1, MEAS_SCHEME/RELE, MEAS_SCHEME/RELE. Parts and nets are listed once, with the designators drawn on the sheet.
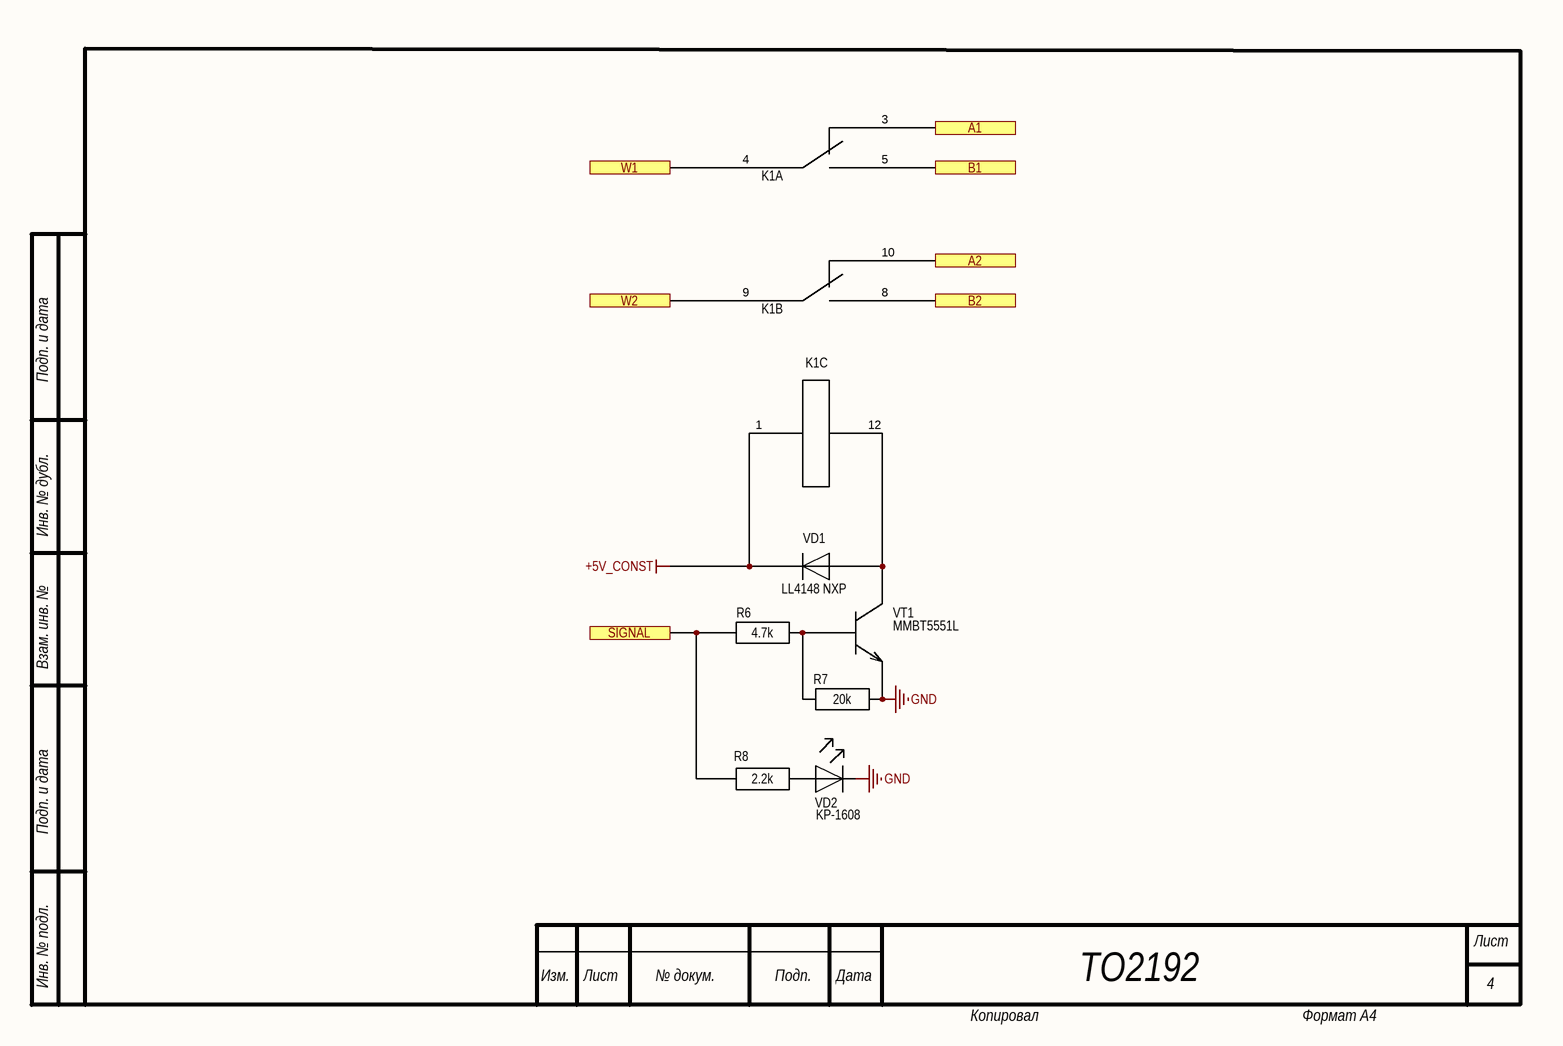
[diagram p3: RELE_BLOCK.SchDoc]

### Parts
K1  V23079A1001B301 TE  [V23079A1001B301]  (value not drawn)  (parts A,B,C of 3)
R6  4.7k  [0805]
R7  20k  [0805]
R8  2.2k  [0603]
VD1  LL4148 NXP  [SOD80C]
VD2  KP-1608  [0805(LED)]
VT1  MMBT5551L  [SOT-23]

### Ports
A1, A2, B1, B2, SIGNAL, W1, W2

### Nets
+5V_CONST: K1.1 VD1.2(K)
GND: R7.2 VD2.2(K) VT1.2(E)
A1: K1.3 ; port A1
A2: K1.10 ; port A2
B1: K1.5 ; port B1
B2: K1.8 ; port B2
SIGNAL: R6.1 R8.1 ; port SIGNAL
W1: K1.4 ; port W1
W2: K1.9 ; port W2
NetK1_12: K1.12 VD1.1(A) VT1.3(K)
NetR6_2: R6.2 R7.1 VT1.1(B)
NetR8_2: R8.2 VD2.1(A)

### Channels
MEAS_SCHEME/RELE: designators K1=K12 R6=R68 R7=R69 R8=R70 VD1=VD23 VD2=VD24 VT1=VT12; ports A1=NetK12_3 A2=NetK12_10 B1=AC_IN B2=DUT_OUT SIGNAL=RELE4 W1=GEN W2=OSC
MEAS_SCHEME/RELE: designators K1=K11 R6=R65 R7=R66 R8=R67 VD1=VD21 VD2=VD22 VT1=VT11; ports A1=AMP+ A2=AMP- B1=NetK11_5 B2=NetK11_5 SIGNAL=RELE2 W1=DUT_VCC W2=V+
MEAS_SCHEME/RELE: designators K1=K10 R6=R62 R7=R63 R8=R64 VD1=VD19 VD2=VD20 VT1=VT10; ports A1=NetK10_3 A2=NetK10_10 B1=INPUT+ B2=INPUT- SIGNAL=RELE7 W1=IN+ W2=IN-
MEAS_SCHEME/RELE: designators K1=K9 R6=R59 R7=R60 R8=R61 VD1=VD17 VD2=VD18 VT1=VT9; ports A1=NetK9_3 A2=NetK9_10 B1=INPUT+ B2=INPUT- SIGNAL=RELE10 W1=NetK9_4 W2=NetK9_9
MEAS_SCHEME/RELE: designators K1=K8 R6=R56 R7=R57 R8=R58 VD1=VD15 VD2=VD16 VT1=VT8; ports A1=NetK8_3 A2=NetK8_10 B1=INPUT+ B2=INPUT- SIGNAL=RELE8 W1=NetK8_4 W2=NetK8_9
MEAS_SCHEME/RELE: designators K1=K7 R6=R53 R7=R54 R8=R55 VD1=VD13 VD2=VD14 VT1=VT7; ports A1=GND A2=NetK7_10 B1=NetK7_5 B2=NetK7_8 SIGNAL=RELE5 W1=INPUT+ W2=NetK7_9
MEAS_SCHEME/RELE: designators K1=K6 R6=R50 R7=R51 R8=R52 VD1=VD11 VD2=VD12 VT1=VT6; ports A1=NetK6_3 A2=OUT B1=GND B2=NetK6_3 SIGNAL=RELE11 W1=NetK6_4 W2=VO_AD
MEAS_SCHEME/RELE: designators K1=K5 R6=R47 R7=R48 R8=R49 VD1=VD9 VD2=VD10 VT1=VT5; ports A1=OUT A2=NetK5_10 B1=NetK5_5 B2=NetK5_8 SIGNAL=RELE6 W1=DUT_OUT W2=NetK5_9
MEAS_SCHEME/RELE: designators K1=K4 R6=R44#2 R7=R45 R8=R46 VD1=VD7 VD2=VD8 VT1=VT4; ports A1=NetK4_3 A2=NetK4_10 B1=TP2 B2=NetK4_8 SIGNAL=RELE12 W1=AUX_OUT W2=NetK4_9
MEAS_SCHEME/RELE: designators K1=K3 R6=R41#2 R7=R42#2 R8=R43#2 VD1=VD5 VD2=VD6 VT1=VT3; ports A1=NetK3_3 A2=NetK3_10 B1=TP2 B2=NetK3_8 SIGNAL=RELE9 W1=NetC18_2 W2=NetK3_9
MEAS_SCHEME/RELE: designators K1=K2 R6=R38#2 R7=R39#2 R8=R40#2 VD1=VD3 VD2=VD4 VT1=VT2; ports A1=DUT_OUT A2=NetK2_10 B1=NetK2_5 B2=NetK2_8 SIGNAL=RELE1 W1=NetC11_1 W2=NetK2_9
MEAS_SCHEME/RELE 1: designators K1=K13 R6=R71 R7=R72 R8=R73 VD1=VD25 VD2=VD26 VT1=VT13; ports A1=NetK13_3 A2=AUX_OUT B1=OUT B2=NetK13_8 SIGNAL=RELE13 W1=VOLT W2=VOLT
MEAS_SCHEME/RELE: designators K1=K1 R6=R35#2 R7=R36#2 R8=R37#2 VD1=VD1 VD2=VD2#1 VT1=VT1; ports A1=DUT_OUT A2=NetK1_10 B1=NetK1_5 B2=DUT_OUT SIGNAL=RELE3 W1=NetK1_4 W2=IN-
MEAS_SCHEME/RELE: designators K1=K14 R6=R74 R7=R75 R8=R8 VD1=VD27 VD2=VD2#2 VT1=VT14; ports A1=NetK14_3 A2=NetK14_3 B1=AMP+ B2=AMP- SIGNAL=RELE2 W1=DUT_VEE W2=V-

### Notes on the sheet
- Подп. и дата
- Инв. № дубл.
- Взам. инв. №
- Инв. № подл.
- Изм.
- Лист
- № докум.
- Подп.
- Дата
- ТО2192
- 4
- Копировал
- Формат А4
- DWG. NO.
- REV.
- SHT.
- THIS DOCUMENT AND THE DATA DISCLOSED HEREIN OR HEREWITH IS THE PROPERTY OF ALTIUM LIMITED AND MAY BE FREELY DISTRIBUTED IN WHOLE. NO RIGHTS ARE RESERVED OR EXPRESS OR IMPLIED WARANTEE GIVEN.
- REVISION
- DESCRIPTION
- DATE
- APPROVED
- ENG:
- APPROVALS
- PROJECT
- DSN:
- CHK:
- REFERENCE DOCUMENTS
- PROJECT REVISION:
- TITLE
- DOCUMENT REVISION:
- DESIGN ITEM:
- BOM:
- FAB DWG:
- PCB DWG:
- ASSY DWG:
- SCALE:
- SIZE
- B
- CAGE CODE
- FILE NAME
- DWG NO.
- SHEET
- OF
- REV

### Library data of the parts
R6 R7 = R0805 Yageo: as R1 on sheet FORMULA; ClassName: *; ComponentWeigt: *; Component Link: *; Packaging: 0805; NN: *; Value: *
R8 = R0603 Yageo: ComponentHeigt: 0.5; Firme: Yageo; Leadform: SMD; Kind: Резистор; ClassName: *; Component Link: *; Packaging: 0402; NN: *
VD1 = LL4148 NXP: ComponentHeigt: 1.6; Leadform: SMD; NN: 24009301; KIND: Диод LL4148 NXP; Component Link: http://www.nxp.com; Packaging: SOD-80C; ClassName: *; Firme: NXP
VD2 = LED(0805): ComponentHeigt: 0.75; Leadform: в отверстия; Firme: Kingbright; NN: 24003000; KIND: Светодиод L-1154GD Kingbright; Component Link: *; ClassName: *
VT1 = MMBT5551L: ComponentHeigt: 1.1; Firme: ONS; Leadform: SMD; NN: 24007468; KIND: Транзистор MMBT5551L*G ONS; ClassName: *; ComponentWeigt: *; Packaging: SOT-23

## Nets that join several sheets
+5V_CONST: FORMULA (X9.+5V), MEAS_SCHEME/RELE (K12.1 VD23.2), MEAS_SCHEME/RELE (K11.1 VD21.2), MEAS_SCHEME/RELE (K10.1 VD19.2), MEAS_SCHEME/RELE (K9.1 VD17.2), MEAS_SCHEME/RELE (K8.1 VD15.2), MEAS_SCHEME/RELE (K7.1 VD13.2), MEAS_SCHEME/RELE (K6.1 VD11.2), MEAS_SCHEME/RELE (K5.1 VD9.2), MEAS_SCHEME/RELE (K4.1 VD7.2), MEAS_SCHEME/RELE (K3.1 VD5.2), MEAS_SCHEME/RELE (K2.1 VD3.2), MEAS_SCHEME/RELE 1 (K13.1 VD25.2), MEAS_SCHEME/RELE (K1.1 VD1.2), MEAS_SCHEME/RELE (K14.1 VD27.2)
GND: Main (11 pins), FORMULA (11 pins), MEAS_SCHEME (12 pins), MEAS_SCHEME/RELE (R69.2 VD24.2 VT12.2), MEAS_SCHEME/RELE (R66.2 VD22.2 VT11.2), MEAS_SCHEME/RELE (R63.2 VD20.2 VT10.2), MEAS_SCHEME/RELE (R60.2 VD18.2 VT9.2), MEAS_SCHEME/RELE (R57.2 VD16.2 VT8.2), MEAS_SCHEME/RELE (K7.3 R54.2 VD14.2 VT7.2), MEAS_SCHEME/RELE (K6.5 R51.2 VD12.2 VT6.2), MEAS_SCHEME/RELE (R48.2 VD10.2 VT5.2), MEAS_SCHEME/RELE (R45.2 VD8.2 VT4.2), MEAS_SCHEME/RELE (R42#2.2 VD6.2 VT3.2), MEAS_SCHEME/RELE (R39#2.2 VD4.2 VT2.2), MEAS_SCHEME/RELE 1 (R72.2 VD26.2 VT13.2), MEAS_SCHEME/RELE (R36#2.2 VD2#1.2 VT1.2), MEAS_SCHEME/RELE (R75.2 VD2#2.2 VT14.2)
+12V: Main (X7.3), FORMULA (R2.2 X9.+12V)
-12V: Main (X7.1), FORMULA (R4.2 X9.-12V)
AC_IN: MEAS_SCHEME (C12.2), MEAS_SCHEME/RELE (K12.5)
AMP+: Main (X4.1), MEAS_SCHEME (X11.1), MEAS_SCHEME/RELE (K11.3), MEAS_SCHEME/RELE (K14.5)
AMP-: Main (X4.2), MEAS_SCHEME (X11.2), MEAS_SCHEME/RELE (K11.10), MEAS_SCHEME/RELE (K14.8)
AUX_OUT: FORMULA (X9.51), MEAS_SCHEME (C18.1 D3.1 R21.2 R44#1.1), MEAS_SCHEME/RELE (K4.4), MEAS_SCHEME/RELE 1 (K13.10)
AUX_VCC: FORMULA (C2.1 C3.1 C4.1 R2.1), MEAS_SCHEME (D2.8 D3.8)
AUX_VEE: FORMULA (C6.1 C7.1 C8.1 R4.1), MEAS_SCHEME (D2.4 D3.4)
DOP: Main (D1.6), FORMULA (X9.38)
DUT_OUT: Main (D1.8), MEAS_SCHEME/RELE (K12.8), MEAS_SCHEME/RELE (K5.4), MEAS_SCHEME/RELE (K2.3), MEAS_SCHEME/RELE (K1.3 K1.8)
DUT_VCC: FORMULA (C1.1 R1.2), MEAS_SCHEME/RELE (K11.4)
DUT_VCC_EXT: Main (X6.3), FORMULA (R1.1 X9.+5V_VCCF X9.+5V_VCCS)
DUT_VEE: FORMULA (C5.1 R3.1), MEAS_SCHEME (SA4.1), MEAS_SCHEME/RELE (K14.4)
DUT_VEE_EXT: Main (X6.1), FORMULA (R3.2 X9.VEEF X9.VEES)
DUT_VO: FORMULA (C9.1 C10.1 R5.1), MEAS_SCHEME (X10.3)
DUT_VO_EXT: Main (X8.1), FORMULA (R5.2 X9.+5V_VDDF X9.+5V_VDDS)
GEN: Main (X1.1 X3.1), MEAS_SCHEME/RELE (K12.4)
IN+: Main (D1.10), MEAS_SCHEME (R30.1), MEAS_SCHEME/RELE (K10.4)
IN-: Main (D1.5), MEAS_SCHEME (R9.2 R10.2 R19.1), MEAS_SCHEME/RELE (K10.9), MEAS_SCHEME/RELE (K1.9)
INPUT+: FORMULA (X9.49), MEAS_SCHEME (R25.2 R39#1.2), MEAS_SCHEME/RELE (K10.5), MEAS_SCHEME/RELE (K9.5), MEAS_SCHEME/RELE (K8.5), MEAS_SCHEME/RELE (K7.4)
INPUT-: FORMULA (X9.50), MEAS_SCHEME (R11.1 R13.1 R14.2), MEAS_SCHEME/RELE (K10.8), MEAS_SCHEME/RELE (K9.8), MEAS_SCHEME/RELE (K8.8)
LOAD_F: FORMULA (X9.37), MEAS_SCHEME (C14.1 C15.1 D2.3)
NetC11_1: MEAS_SCHEME (C11.1), MEAS_SCHEME/RELE (K2.4)
NetC18_2: MEAS_SCHEME (C18.2 R42#1.1 R43#1.2), MEAS_SCHEME/RELE (K3.4)
NetK1_4: MEAS_SCHEME (R9.1), MEAS_SCHEME/RELE (K1.4)
NetK5_5: MEAS_SCHEME (R22.2), MEAS_SCHEME/RELE (K5.5)
NetK6_3: MEAS_SCHEME (X10.2), MEAS_SCHEME/RELE (K6.3 K6.8)
NetK6_4: MEAS_SCHEME (R12.1), MEAS_SCHEME/RELE (K6.4)
NetK7_5: MEAS_SCHEME (R23.1), MEAS_SCHEME/RELE (K7.5)
NetK8_4: MEAS_SCHEME (R26.1 R27.2), MEAS_SCHEME/RELE (K8.4)
NetK8_9: MEAS_SCHEME (R15.1 R16.2), MEAS_SCHEME/RELE (K8.9)
NetK9_4: MEAS_SCHEME (R28.1 R29.2), MEAS_SCHEME/RELE (K9.4)
NetK9_9: MEAS_SCHEME (R17.1 R18.2), MEAS_SCHEME/RELE (K9.9)
OSC: Main (X5.1), MEAS_SCHEME/RELE (K12.9)
OUT: FORMULA (X9.36), MEAS_SCHEME (6 pins), MEAS_SCHEME/RELE (K6.10), MEAS_SCHEME/RELE (K5.3), MEAS_SCHEME/RELE 1 (K13.5)
RELE1: FORMULA (X9.OUT1), MEAS_SCHEME/RELE (R38#2.1 R40#2.1)
RELE2: FORMULA (X9.IN-OUT1), MEAS_SCHEME/RELE (R65.1 R67.1), MEAS_SCHEME/RELE (R8.1 R74.1)
RELE3: FORMULA (X9.OUT2), MEAS_SCHEME/RELE (R35#2.1 R37#2.1)
RELE4: FORMULA (X9.IN-OUT2), MEAS_SCHEME/RELE (R68.1 R70.1)
RELE5: FORMULA (X9.OUT3), MEAS_SCHEME/RELE (R53.1 R55.1)
RELE6: FORMULA (X9.IN-OUT3), MEAS_SCHEME/RELE (R47.1 R49.1)
RELE7: FORMULA (X9.OUT4), MEAS_SCHEME/RELE (R62.1 R64.1)
RELE8: FORMULA (X9.IN-OUT4), MEAS_SCHEME/RELE (R56.1 R58.1)
RELE9: FORMULA (X9.OUT5), MEAS_SCHEME/RELE (R41#2.1 R43#2.1)
RELE10: FORMULA (X9.IN-OUT5), MEAS_SCHEME/RELE (R59.1 R61.1)
RELE11: FORMULA (X9.OUT6), MEAS_SCHEME/RELE (R50.1 R52.1)
RELE12: FORMULA (X9.IN-OUT6), MEAS_SCHEME/RELE (R44#2.1 R46.1)
RELE13: FORMULA (X9.OUT7), MEAS_SCHEME/RELE 1 (R71.1 R73.1)
TP2: MEAS_SCHEME (R40#1.1 R41#1.2), MEAS_SCHEME/RELE (K4.5), MEAS_SCHEME/RELE (K3.5)
V+: Main (D1.7), MEAS_SCHEME (C16.1), MEAS_SCHEME/RELE (K11.9)
V-: Main (D1.9), MEAS_SCHEME (C17.1 SA4.2), MEAS_SCHEME/RELE (K14.9)
VO_AD: MEAS_SCHEME (R24.1), MEAS_SCHEME/RELE (K6.9)
VOLT: Main (X2.1), MEAS_SCHEME/RELE 1 (K13.4 K13.9)